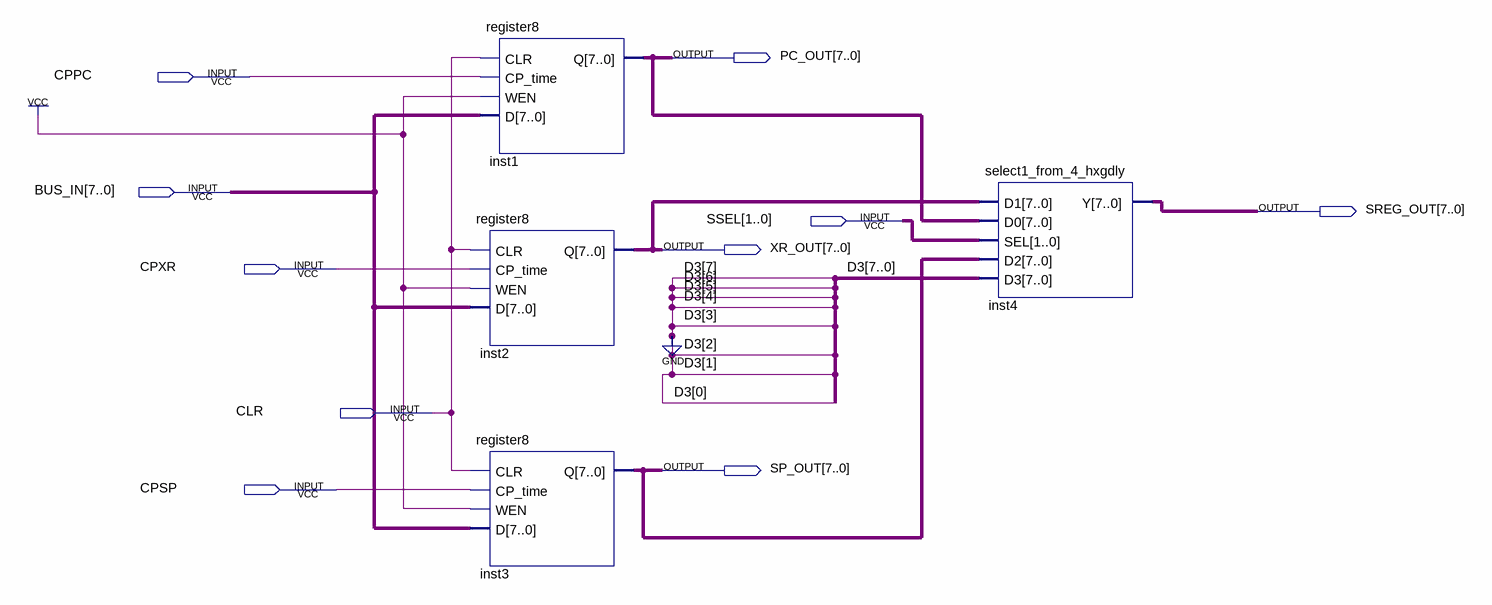
[diagram p0: schematic sheet]
// Quartus schematic SPR_hxgdly.bdf as structural Verilog: 4 symbols, 10 pins
module SPR_hxgdly (
  input  CPPC,
  input  [7:0] BUS_IN,
  input  [1:0] SSEL,
  input  CPXR,
  input  CLR,
  input  CPSP,
  output [7:0] PC_OUT,
  output [7:0] SREG_OUT,
  output [7:0] XR_OUT,
  output [7:0] SP_OUT
);

  register8 inst1 (.CLR(CLR), .CP_time(CPPC), .WEN(1'b1), .D(BUS_IN), .Q(PC_OUT));
  register8 inst2 (.CLR(CLR), .CP_time(CPXR), .WEN(1'b1), .D(BUS_IN), .Q(XR_OUT));
  register8 inst3 (.CLR(CLR), .CP_time(CPSP), .WEN(1'b1), .D(BUS_IN), .Q(SP_OUT));
  select1_from_4_hxgdly inst4 (.D1(XR_OUT), .D0(PC_OUT), .SEL(SSEL), .D2(SP_OUT), .D3({8{1'b0}}), .Y(SREG_OUT));
endmodule
